# Altium schematic sheet Sheet1.SchDoc
size A; SheetNumber: 1; SheetTotal: 1; SPICEModelCachePNHWIOMB: <root> / <DocumentId>PNHWIOMB</DocumentId> / <CacheFrame Number="0"> / <Model Name="11dq03" Kind="MDL"> / <Text>*11DQ03 MCE 7-17-95 / *Ref: IR Power Semiconductors Product Digest '94 / *MCE 30V 1.1A pkg:DIODE0.4 1,2 / .MODEL 11DQ03 D(IS=5.18E-9 RS=0.146 N=0.878 TT=4.32E-6 CJO=1.18E-10 / + VJ=0.75 M=0.333 EG=0.69 XTI=2 BV=30 IBV=6.01E-6 )</Text> / </Model> / </CacheFrame> / </root>
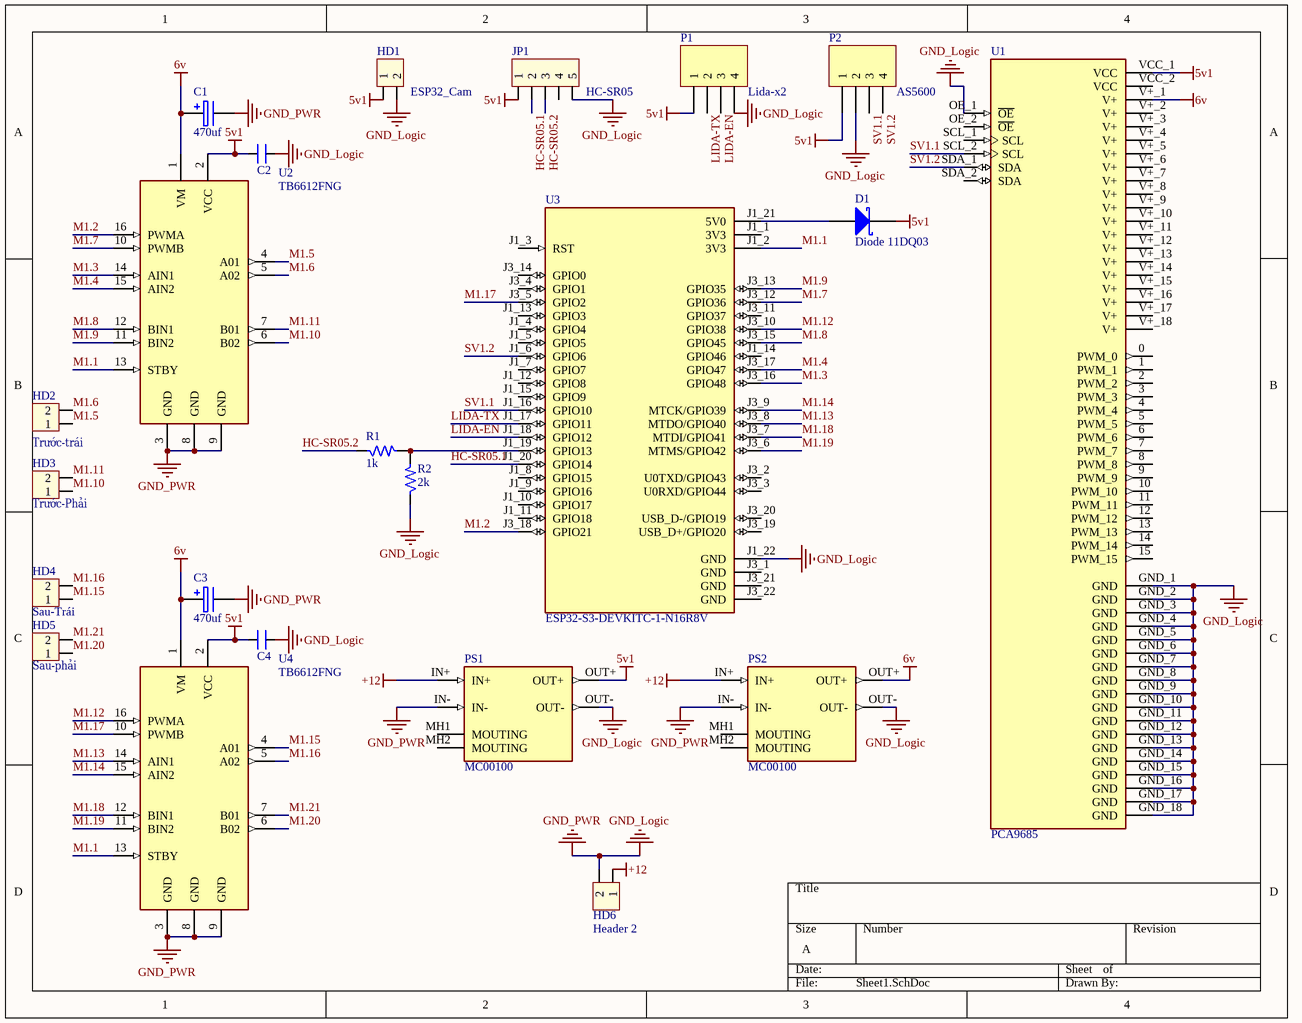
[diagram p0: Sheet1.SchDoc]

## Parts
C1  470uf  [CP1/2]
C2  CAP gom  [CN1]  (value not drawn)
C3  470uf  [CP1/2]
C4  CAP gom  [CN1]  (value not drawn)
D1  Diode 11DQ03  [DO-204AL]
HD1  ESP32_Cam  [HED2]
HD2  Trước-trái  [HED2]
HD3  Trước-Phải  [HED2]
HD4  Sau-Trái  [HED2]
HD5  Sau-phải  [HED2]
HD6  Header 2  [HED2]
JP1  HC-SR05  [jam5]
P1  Lida-x2  [HDR1X4]
P2  AS5600  [HDR1X4]
PS1  MC00100  [CONV_MC00100]
PS2  MC00100  [CONV_MC00100]
R1  1k  [R1/4W]
R2  2k  [R1/4W]
U1  PCA9685  [MODULE_815]
U2  TB6612FNG  [TB6612FNG]
U3  ESP32-S3-DEVKITC-1-N16R8V  [XCVR_ESP32-S3-DEVKITC-1-N16R8V]
U4  TB6612FNG  [TB6612FNG]

## Nets
5v1: C2.1 C4.1 D1.2(K) HD1.1 JP1.1 P1.1 P2.1 PS1.OUT+ U1.VCC_1(VCC) U2.2(VCC) U4.2(VCC)
6v: C1.1 C3.1 PS2.OUT+ U1.V+_1(V+) U2.1(VM) U4.1(VM)
+12: HD6.1 PS1.IN+ PS2.IN+
GND_Logic: C1.2 C2.2 C3.2 C4.2 HD1.2 HD6.2 JP1.5 P1.4 P2.2 PS1.IN- PS1.OUT- PS2.IN- PS2.OUT- R2.1 U1.GND_1(GND) U1.GND_2(GND) U1.GND_3(GND) U1.GND_4(GND) U1.GND_5(GND) U1.GND_6(GND) U1.GND_7(GND) U1.GND_8(GND) U1.GND_9(GND) U1.GND_10(GND) U1.GND_11(GND) U1.GND_12(GND) U1.GND_13(GND) U1.GND_14(GND) U1.GND_15(GND) U1.GND_16(GND) U1.GND_17(GND) U1.GND_18(GND) U1.OE_1(~{OE}) U2.3(GND) U2.8(GND) U2.9(GND) U3.J1_22(GND) U4.3(GND) U4.8(GND) U4.9(GND)  [also labelled GND_PWR]
HC-SR05.1: JP1.2 U3.J1_20(GPIO14)
HC-SR05.2: JP1.3 R1.1
LIDA-EN: P1.3 U3.J1_18(GPIO12)
LIDA-TX: P1.2 U3.J1_17(GPIO11)
M1.1: U2.13(STBY) U3.J1_2(3V3) U4.13(STBY)
M1.2: U2.16(PWMA) U3.J3_18(GPIO21)
M1.3: U2.14(AIN1) U3.J3_16(GPIO48)
M1.4: U2.15(AIN2) U3.J3_17(GPIO47)
M1.5: HD2.1 U2.4(A01)
M1.6: HD2.2 U2.5(A02)
M1.7: U2.10(PWMB) U3.J3_12(GPIO36)
M1.8: U2.12(BIN1) U3.J3_15(GPIO45)
M1.9: U2.11(BIN2) U3.J3_13(GPIO35)
M1.10: HD3.1 U2.6(B02)
M1.11: HD3.2 U2.7(B01)
M1.12: U3.J3_10(GPIO38) U4.16(PWMA)
M1.13: U3.J3_8(MTDO/GPIO40) U4.14(AIN1)
M1.14: U3.J3_9(MTCK/GPIO39) U4.15(AIN2)
M1.15: HD4.1 U4.4(A01)
M1.16: HD4.2 U4.5(A02)
M1.17: U3.J3_5(GPIO2) U4.10(PWMB)
M1.18: U3.J3_7(MTDI/GPIO41) U4.12(BIN1)
M1.19: U3.J3_6(MTMS/GPIO42) U4.11(BIN2)
M1.20: HD5.1 U4.6(B02)
M1.21: HD5.2 U4.7(B01)
SV1.1: P2.3 U1.SCL_2(SCL) U3.J1_16(GPIO10)
SV1.2: P2.4 U1.SDA_1(SDA) U3.J1_6(GPIO6)
NetD1_1: D1.1(A) U3.J1_21(5V0)
NetR1_2: R1.2 R2.2 U3.J1_19(GPIO13)

Not connected (* = marked no-connect by the designer): JP1 4; PS1 MH1(MOUTING) MH2(MOUTING); PS2 MH1(MOUTING) MH2(MOUTING); U1 0(PWM_0) 1(PWM_1) 2(PWM_2) 3(PWM_3) 4(PWM_4) 5(PWM_5) 6(PWM_6) 7(PWM_7) 8(PWM_8) 9(PWM_9) 10(PWM_10) 11(PWM_11) 12(PWM_12) 13(PWM_13) 14(PWM_14) 15(PWM_15) OE_2(~{OE}) SCL_1(SCL) SDA_2(SDA) V+_2(V+) V+_3(V+) V+_4(V+) V+_5(V+) V+_6(V+) V+_7(V+) V+_8(V+) V+_9(V+) V+_10(V+) V+_11(V+) V+_12(V+) V+_13(V+) V+_14(V+) V+_15(V+) V+_16(V+) V+_17(V+) V+_18(V+) VCC_2(VCC); U3 J1_1(3V3) J1_3(RST) J1_4(GPIO4) J1_5(GPIO5) J1_7(GPIO7) J1_8(GPIO15) J1_9(GPIO16) J1_10(GPIO17) J1_11(GPIO18) J1_12(GPIO8) J1_13(GPIO3) J1_14(GPIO46) J1_15(GPIO9) J3_1(GND) J3_2(U0TXD/GPIO43) J3_3(U0RXD/GPIO44) J3_4(GPIO1) J3_11(GPIO37) J3_14(GPIO0) J3_19(USB_D+/GPIO20) J3_20(USB_D-/GPIO19) J3_21(GND) J3_22(GND)

## Library data of the parts
C1 C3 = CAP hoa: Cap
D1 = Diode 11DQ03: Schottky Rectifier; Published: 8-Jun-2000; LatestRevisionDate: 17-Jul-2002; LatestRevisionNote: Re-released for DXP Platform.; DatasheetVersion: Dec-1997; PackageReference: DO-204AL; Publisher: Altium Limited; PackageDescription: Diode, Axial; Body 5.2 x 2.7 mm (LxDia. max), Lead Dia. 0.86 mm (max); Code_JEDEC: DO-204-AL; ComponentLink1Description: Manufacturer Link; ComponentLink1URL: http://www.irf.com/; ComponentLink2Description: Datasheet; ComponentLink2URL: http://www.irf.com/product-info/datasheets/data/11dq03.pdf
HD1-HD6 = Header 2: Header 2 (Green); Value: Header 2
JP1 = jam 5: Value: Connector 5
P1 P2 = Header 4: Header, 4-Pin; LatestRevisionDate: 17-Jul-2002; LatestRevisionNote: Re-released for DXP Platform.; Publisher: Altium Limited
PS1 PS2 = MC00100: DC-DC LM2596 Step Down Adjustable Converter Power Supply Module 1.3V-35V; MF: YKS; SnapEDA_Link: https://www.snapeda.com/parts/MC00100/YKS/view-part/?ref=snap; Package: None; Value: *; MP: MC00100; Check_prices: https://www.snapeda.com/parts/MC00100/YKS/view-part/?ref=eda
R1 R2 = Res
U1 = 815: Adafruit 16-Channel 12-bit PWM/Servo Driver - I2C interface - PCA9685; SnapEDA_Link: https://www.snapeda.com/parts/815/Adafruit+Industries/view-part/?ref=snap; Package: Non-Standard Adafruit; Value: *; MF: Adafruit; MP: 815; Check_prices: https://www.snapeda.com/parts/815/Adafruit+Industries/view-part/?ref=eda
U2 U4 = TB6612FNG: TB6612FNG Dual Motor Driver Module; ComponentLink1Description: Data Sheet; ComponentLink1URL: https://www.pololu.com/file/0J86/TB6612FNG.pdf
U3 = ESP32-S3-DEVKITC-1-N16R8V: Development Boards & Kits - Wireless Gen-Purpose Dev Board, embeds ESP32-S3-WROOM-2-N16R8V, 16 MB Octal Flash, 8 MB Octal PSRAM, with Pin Header; MF: Espressif Systems; SnapEDA_Link: https://www.snapeda.com/parts/ESP32-S3-DEVKITC-1-N16R8V/Espressif+Systems/view-part/?ref=snap; Package: None; Value: *; MP: ESP32-S3-DEVKITC-1-N16R8V; Check_prices: https://www.snapeda.com/parts/ESP32-S3-DEVKITC-1-N16R8V/Espressif+Systems/view-part/?ref=eda